# Altium schematic sheet STM32WBA52KGU6_Core.SchDoc
size 420 x 297 mm; SheetNumber: 3; SheetTotal: 3
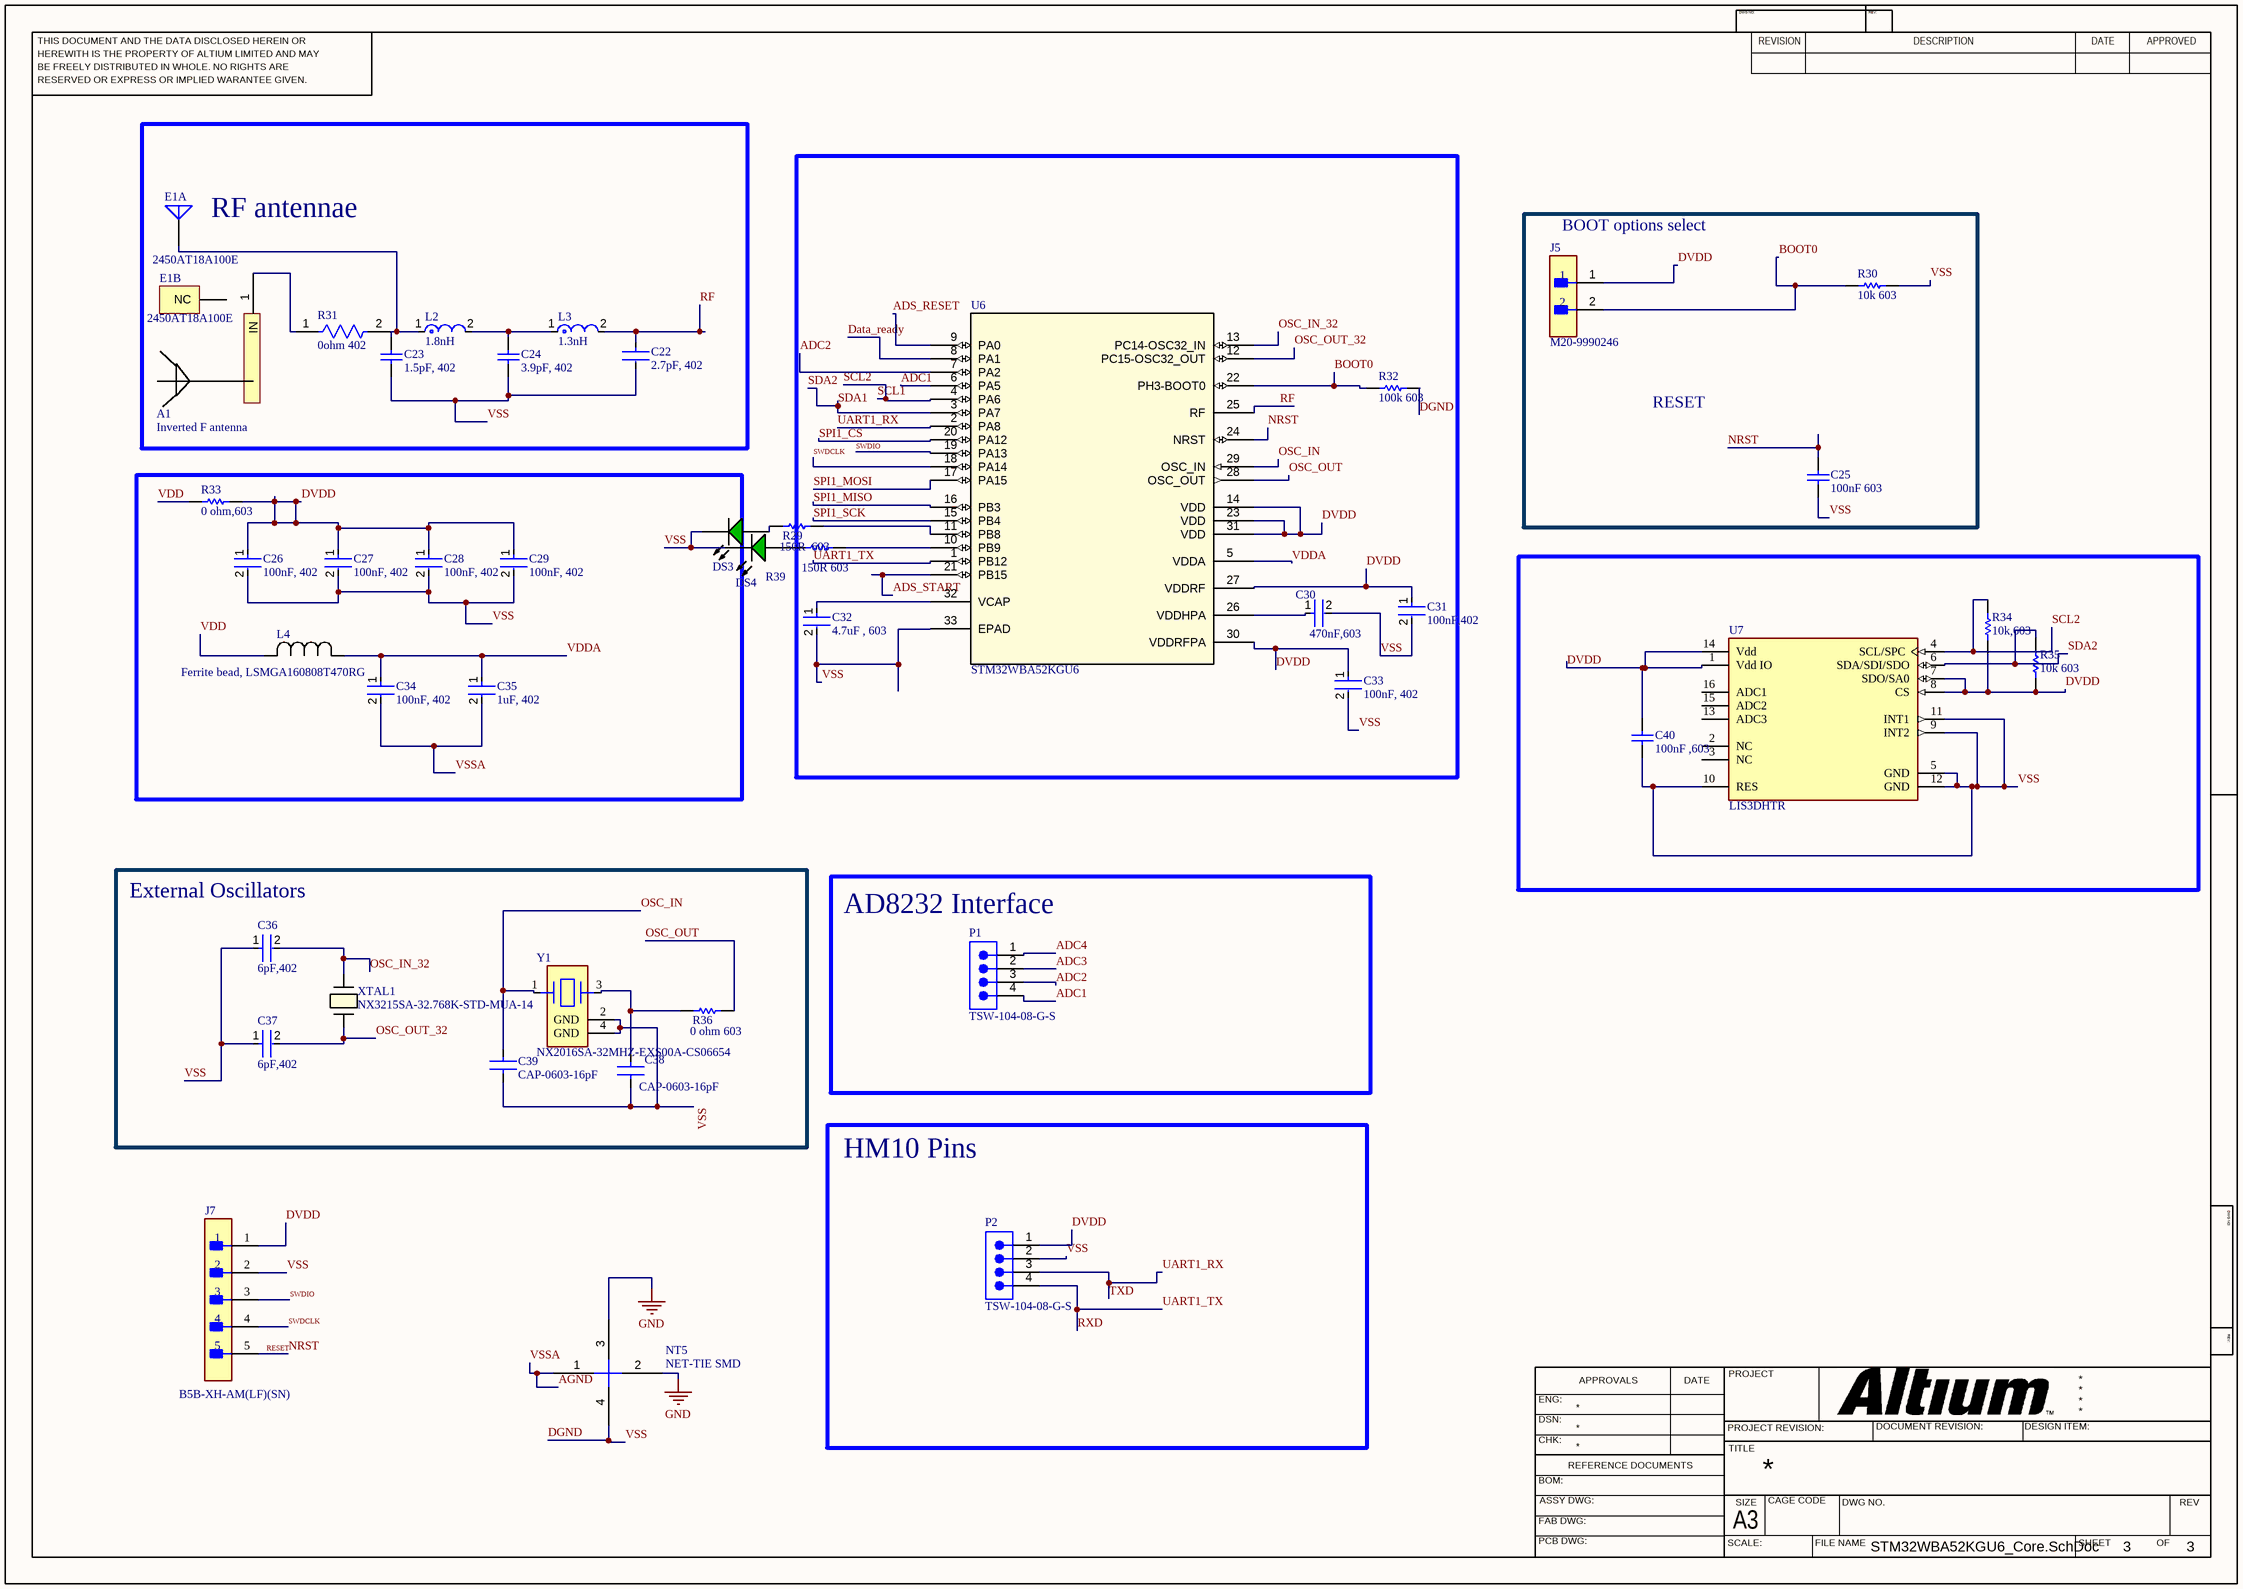
[diagram p0: STM32WBA52KGU6_Core.SchDoc]

## Parts
A1  Inverted F antenna  [Antenna]  (net tie, no BOM)
C22  2.7pF, 402  [FP-GJM155-0_05-IPC_A]
C23  1.5pF, 402  [CAPC1005X55X25ML05T10]
C24  3.9pF, 402  [CAPC1005X55X25NL05T10]
C25  100nF 603  [CAP-0603-IPC_B]
C26  100nF, 402  [FP-CC0402-MFG]
C27  100nF, 402  [FP-CC0402-MFG]
C28  100nF, 402  [FP-CC0402-MFG]
C29  100nF, 402  [FP-CC0402-MFG]
C30  470nF,603  [FP-CC0603-DA-MFG]
C31  100nF,402  [FP-CC0402-MFG]
C32  4.7uF , 603  [FP-CC0603-DA-MFG]
C33  100nF, 402  [FP-CC0402-MFG]
C34  100nF, 402  [FP-CC0402-MFG]
C35  1uF, 402  [FP-CC0402-MFG]
C36  6pF,402  [FP-GJM155-0_05-MFG]
C37  6pF,402  [FP-GJM155-0_05-MFG]
C38  CAP-0603-16pF  [FP-GCM188-0_1-IPC_A_murata]
C39  CAP-0603-16pF  [FP-GCM188-0_1-IPC_A_murata]
C40  100nF ,603  [CAP-0603-IPC_B]
DS3  LTL-1CHG  [LTST-LTL-1CHG-2]  (value not drawn)
DS4  LTL-1CHG  [LTST-LTL-1CHG-2]  (value not drawn)
E1  2450AT18A100E  [JT-2450AT18A100-2_V]  (parts A,B of 2)
J5  M20-9990246  [FP-M20-9990246-MFG]
J7  B5B-XH-AM(LF)(SN)  [FP-B5B-XH-AM_LF_SN-MFG]
L2  1.8nH  [FP-LQG15HH_02-IPC_A]
L3  1.3nH  [FP-LQG15HH_02-IPC_A]
L4  Ferrite bead, LSMGA160808T470RG  [IND_LSMG_160808_TAY]
NT5  NET-TIE SMD  [NET TIE SMD]
P1  TSW-104-08-G-S  [SMTC-TSW-104-08-X-S]
P2  TSW-104-08-G-S  [SMTC-TSW-104-08-X-S]
R29  150R  603  [RES-0603-IPC_B]
R30  10k 603  [RES-0603-IPC_B]
R31  0ohm 402  [FP-RC0402-0_4-IPC_A]
R32  100k 603  [RES-0603-IPC_B]
R33  0 ohm,603  [RES-0603-IPC_B]
R34  10k,603  [RES-0603-IPC_B]
R35  10k 603  [RES-0603-IPC_B]
R36  0 ohm 603  [RES-0603-IPC_B]
R39  150R 603  [RES-0603-IPC_B]
U6  STM32WBA52KGU6  [UFQFPN-32_STM]
U7  LIS3DHTR  [FP-LGA-16-7983231-MFG]
XTAL1  NX3215SA-32.768K-STD-MUA-14  [XTAL_NX3215SA_NDK-M]
Y1  NX2016SA-32MHZ-EXS00A-CS06654  [FP-NX2016SA-MFG]

## Blocks framed on the sheet
RF antennae: A1 C22-C24 E1 L2 L3 R31
External Oscillators: C36-C39 R36 XTAL1 Y1
AD8232 Interface: P1
HM10 Pins: P2

## Nets
GND: NT5.2 NT5.3
ADC1: P1.4 U6.6(PA5)
ADC2: P1.3 U6.7(PA2)
ADC3: P1.2
ADC4: P1.1
ADS_RESET: U6.9(PA0)
ADS_START: U6.21(PB15)
AGND: C34.2 C35.2 NT5.1  [also labelled VSSA]
BOOT0: J5.2 R30.1 R32.2 U6.22(PH3-BOOT0)
Data_ready: U6.8(PA1)
DGND: C22.2 C23.1 C24.2 C25.1 C26.2 C27.2 C28.2 C29.2 C30.2 C31.2 C32.2 C33.2 C36.1 C37.1 C38.1 C39.1 C40.1 DS3.2(K) DS4.2(K) J7.2 NT5.4 P2.2 R30.2 R32.1 U6.33(EPAD) U7.5(GND) U7.9(INT2) U7.10(RES) U7.11(INT1) U7.12(GND) Y1.2(GND) Y1.4(GND)  [also labelled VSS]
DVDD: C26.1 C27.1 C28.1 C29.1 C31.1 C33.1 C40.2 J5.1 J7.1 P2.1 R33.1 R34.1 R35.1 U6.14(VDD) U6.23(VDD) U6.27(VDDRF) U6.30(VDDRFPA) U6.31(VDD) U7.1(Vdd_IO) U7.7(SDO/SA0) U7.8(CS) U7.14(Vdd)
NRST: C25.2 J7.5 U6.24(NRST)  [also labelled RESET]
OSC_IN: C39.2 U6.29(OSC_IN) Y1.1
OSC_IN_32: C36.2 U6.13(PC14-OSC32_IN) XTAL1.1
OSC_OUT: R36.2 U6.28(OSC_OUT)
OSC_OUT_32: C37.2 U6.12(PC15-OSC32_OUT) XTAL1.2
RF: C22.1 L3.2 U6.25(RF)
RXD: P2.4 U6.1(PB12)  [also labelled UART1_TX]
SCL1: R34.2 U6.4(PA6) U7.4(SCL/SPC)  [also labelled SCL2]
SDA1: R35.2 U6.3(PA7) U7.6(SDA/SDI/SDO)  [also labelled SDA2]
SPI1_CS: U6.20(PA12)
SPI1_MISO: U6.16(PB3)
SPI1_MOSI: U6.17(PA15)
SPI1_SCK: U6.15(PB4)
SWDCLK: J7.4 U6.18(PA14)
SWDIO: J7.3 U6.19(PA13)
TXD: P2.3 U6.2(PA8)  [also labelled UART1_RX]
VDD: L4.2 R33.2
VDDA: C34.1 C35.1 L4.1 U6.5(VDDA)
NetA1_1: A1.1(IN) R31.1
NetC23_2: C23.2 E1.1(FP) L2.1
NetC24_1: C24.1 L2.2 L3.1
NetC30_1: C30.1 U6.26(VDDHPA)
NetC32_1: C32.1 U6.32(VCAP)
NetC38_2: C38.2 R36.1 Y1.3
NetDS3_1: DS3.1(A) R29.1
NetDS4_1: DS4.1(A) R39.1
NetR29_2: R29.2 U6.11(PB8)
NetR39_2: R39.2 U6.10(PB9)

Not connected (* = marked no-connect by the designer): E1 2(NC); R31 2; U7 2(NC) 3(NC) 13(ADC3) 15(ADC2) 16(ADC1)

## Notes on the sheet
- (near J5) BOOT options select
- RESET
- THIS DOCUMENT AND THE DATA DISCLOSED HEREIN OR
- HEREWITH IS THE PROPERTY OF ALTIUM LIMITED AND MAY
- DWG NO:
- REVISION
- REV:
- DESCRIPTION
- DATE
- APPROVED
- BE FREELY DISTRIBUTED IN WHOLE. NO RIGHTS ARE
- RESERVED OR EXPRESS OR IMPLIED WARANTEE GIVEN.
- ENG:
- APPROVALS
- PROJECT
- DSN:
- CHK:
- REFERENCE DOCUMENTS
- PROJECT REVISION:
- TITLE
- DOCUMENT REVISION:
- DESIGN ITEM:
- BOM:
- FAB DWG:
- PCB DWG:
- ASSY DWG:
- SCALE:
- A3
- SIZE
- CAGE CODE
- FILE NAME
- DWG NO.
- SHEET
- OF
- REV

## Library data of the parts
A1 = PCB antenna
C22 = CMP-06035-021399-1: Multi-Layer Ceramic Capacitor 2.7pF C0G  ±0.1pF 0402 Paper T/R
C23 = CMP-2008-04287-1: Part Number: GRM1555C1H1R5CA01D; Manufacturer: Murata
C24 = CMP-2008-04360-1: Part Number: GRM1555C1H3R9CA01D; Manufacturer: Murata
C25 = 1nF CAP-0603-IPC-B_1: Manufacturer: AVX Interconnect / Elco; Part Number: 0603ZC103MAT2A
C26-C29 C31 C33 C34 = CMP-03422-000048-1: CAP CER 0.1UF 16V X7R 0402; Manufacturer: YAGEO; Manufacturer Part Number: CC0402KRX7R7BB104; Material: Ceramic; Automotive Grade: NA; Temperature Coefficient: 30ppm/°C; Tolerance: 0.1; Device Class L1: Passive Components; Temperature Range Low: -55°C; Device Class L3: Ceramic Capacitors; Temperature Characteristic: X7R; Ipc Land Pattern Name: CAPC10050X50; Capacitance: 100 nF; Temperature Range High: +125°C; Voltage Rating: 16 V; Temperature: -55°C to +125°C; RoHS: TRUE; Automotive: No; Height: 0.55mm; Device Class L2: Capacitors; Digikey Description: CAP CER 0.1UF 16V X7R 0402; Package: CC0402; Footprint Url: http://www.yageo.com/exep/pages/download/literatures/UPY-C_GEN_24.pdf; ComponentLink2Description: Datasheet; Category: Cap; Lead Free: Yes; Value: 100 nF; Octopart: https://octopart.com/cc0402krx7r7bb104-yageo-42244624; ComponentLink2URL: http://www.yageo.com/documents/recent/UPY-GP_NP0_16V-to-50V_16.pdf; Mouser Description: 0402 0.1 uF 16 V ±10 % Tolerance X7R SMT Multilayer Ceramic Capacitor
C30 = CMP-03422-000540-1: CAP CER 0.47UF 16V X7R 0603; Manufacturer Part Number: CC0603KRX7R7BB474; Manufacturer: YAGEO; Temperature Coefficient: 15%; Tolerance: 0.1; Material: Ceramic; Device Class L1: Passive Components; Height: 0.9mm; Device Class L3: Ceramic Capacitors; Footprint Url: http://www.yageo.com/exep/pages/download/literatures/UPY-C_GEN_24.pdf; Automotive: No; Temperature Range High: +125°C; ComponentLink2Description: Datasheet; Temperature: -55°C to +125°C; Value: 470 nF; Digikey Description: CAP CER 0.47UF 16V X7R 0603; Capacitance: 470 nF; Mouser Description: Multilayer Ceramic Capacitors MLCC - SMD/SMT 470nF 16V X7R 10%; Temperature Range Low: -55°C; RoHS: TRUE; Voltage: 16 V; Category: Cap; Lead Free: Yes; Device Class L2: Capacitors; Octopart: https://octopart.com/cc0603krx7r7bb474-yageo-8376533; Package: CC0603-DA; Voltage Rating: 16 V; Temperature Characteristic: X7R; ComponentLink2URL: http://www.yageo.com/documents/recent/UPY-GPHC_X7R_6.3V-to-50V_18.pdf
C32 = CMP-2000-06074-2: CAP CER 4.7UF 10V X5R 0603; Manufacturer Part Number: CC0603KRX5R6BB475; Manufacturer: YAGEO; Temperature Coefficient: 15%; Tolerance: 0.1; Material: Ceramic; Voltage Rating: 10 V; ComponentLink2URL: http://www.yageo.com/documents/recent/UPY-GPHC_X7R_6.3V-to-50V_18.pdf; Package: CC0603-DA; Temperature Range High: +125°C; Category: Cap; ComponentLink2Description: Datasheet; Lead Free: Yes; Mouser Description: 4.7µF Surface Mount, MLCC 0603 (1608 Metric) Package Ceramic Capacitors; Device Class L2: Capacitors; Temperature Characteristic: X5R; Voltage: 10 V; RoHS: TRUE; Octopart: https://octopart.com/cc0603krx5r6bb475-yageo-9292507; Automotive: No; Height: 0.9mm; Temperature: -55°C to +125°C; Temperature Range Low: -55°C; Value: 4.7 uF; Digikey Description: CAP CER 4.7UF 10V X5R 0603; Device Class L1: Passive Components; Capacitance: 4.7 uF; Footprint Url: http://www.yageo.com/exep/pages/download/literatures/UPY-C_GEN_24.pdf; Device Class L3: Ceramic Capacitors
C35 = CMP-03422-000489-1: CAP CER 1UF 10V X5R 0402; Manufacturer Part Number: CC0402KRX5R6BB105; Manufacturer: YAGEO; Temperature Coefficient: 30ppm/°C; Tolerance: 0.1; Automotive Grade: NA; Material: Ceramic; Device Class L1: Passive Components; Ipc Land Pattern Name: CAPC10050X50; Height: 0.55mm; Voltage Rating: 10 V; Digikey Description: CAP CER 1UF 10V X5R 0402; RoHS: TRUE; Temperature: -55°C to +125°C; Octopart: https://octopart.com/cc0402krx5r6bb105-yageo-42244620; Mouser Description: Multilayer Ceramic Capacitors MLCC - SMD/SMT 1uF 10V X5R 10%; Temperature Characteristic: X5R; Category: Cap; Automotive: No; Temperature Range Low: -55°C; Value: 1 uF; ComponentLink2Description: Datasheet; Temperature Range High: +125°C; Package: CC0402; Capacitance: 1 uF; Footprint Url: http://www.yageo.com/exep/pages/download/literatures/UPY-C_GEN_24.pdf; ComponentLink2URL: http://www.yageo.com/documents/recent/UPY-GP_NP0_16V-to-50V_16.pdf; Lead Free: Yes; Device Class L3: Ceramic Capacitors; Device Class L2: Capacitors
C36 C37 = CMP-2008-03869-2: Multi-Layer Ceramic Capacitor 6pF C0G  ±0.25pF 0402 Paper T/R; Voltage Rating: 50V; Mount: Surface Mount; Case Code (Metric): 1005; Thickness: 0.022inch; Length: 1mm; Max Operating Temperature: 125°C; Capacitance: 6pF; Depth: 0.5mm; Width: 0.02inch; Dielectric: C0G; Voltage: 50V; Radiation Hardening: No; Min Operating Temperature: -55°C; Case/Package: 0402; Height: 0.5mm; Termination: SMD/SMT; Packaging: Tape and Reel; Voltage Rating (DC): 50V; Package Quantity: 10000; Lead Free: Lead Free; Case Code (Imperial): 0402
C38 C39 = CAP-0603_16V- 16pf_murata: Ceramic Capacitor for Automotive 16pF  ±5% 100VDC C0G 0603 Paper T/R; Voltage Rating: 100V; Min Operating Temperature: -55°C; Package Quantity: 4000; Case/Package: 0603; Height: 0.8mm; Tolerance: 5%; Depth: 0.8mm; Thickness: 0.035inch; Max Operating Temperature: 125°C; Ratings: AEC-Q200; Packaging: Tape and Reel; Termination: SMD/SMT; Mount: Surface Mount; Voltage Rating (DC): 100V; Case Code (Imperial): 0603; Length: 1.6mm; Capacitance: 16pF; Case Code (Metric): 1608; Dielectric: C0G; Radiation Hardening: No; Width: 0.031inch
C40 = CAP-0603-IPC-B: Manufacturer: AVX Interconnect / Elco; Part Number: 0603ZC103MAT2A
DS3 DS4 = CMP-007-00019-2: LED Uni-Color Green, 100 mW, 30 mA, -55 to 100 degC, 2-Pin THD, RoHS, Bulk; Manufacturer: Lite-On; Power: 100mW; Forward Voltage: 2.6V; Forward Current: 30mA; Nominal Vf: 2.1V; Lens Style: Dome; Viewing Angle: 60degrees; Luminous Intensity: 12.6mcd; Max Operating Temperature: 100°C; Case/Package: Radial; Package Reference: LTL-1CHG; Manufacturer URL: http://www.us.liteon.com/; Package Quantity: 1000; Colour: Green; Packaging: Bulk; RoHS Compliant: True; Datasheet URL: http://datasheet.octopart.com/LTL-1CHG-Lite-On-datasheet-143841.pdf; Package Description: 2-Pin Through Hole Device, Dia 3.8 mm; Min Operating Temperature: -55°C; Mounting Technology: TH; Pins: 2; Illumination Colour: Green; Datasheet Version: Mar-00
E1 = CMP-2000-05167-1: Ceramic Antenna, 2.45 GHZ, 2 W, -40 to 125 degC, 2-Pin SMD, RoHS, Tape and Reel; Manufacturer: Johanson Technology; Maximum Frequency: 2500MHz; Typical Antenna Gain: 0.5dB; Minimum Frequency: 2400MHz; Manufacturer URL: https://www.johansontechnology.com/; Type: Ceramic; Datasheet Version: Rev. 1.3, 07/2014; Category: Antenna; Package: 2Case18-4; Datasheet URL: http://www.johansontechnology.com/datasheets/antennas/2450AT18A100.pdf
J5 = CMP-15831-000009-1: CONN HEADER VERT 2POS 2.54MM; Manufacturer: Harwin; Conn Gender: Male; Conn Orientation: Vertical; Number Of Contacts: 2; Current Rating: 3A; ComponentLink2URL: https://cdn.harwin.com/pdfs/M20-999.pdf; ComponentLink2Description: Datasheet; Package: M20-9990246; Temperature: -40°C to +105°C; Octopart: https://octopart.com/m20-9990246-harwin-2590635; Mouser Description: 2.54mm (0.1") Pitch SIL Vertical PC Tail Pin Header, 6.1mm mating pin height, tin, 2 contacts; Temperature Range High: +105°C; Device Class L1: Connectors; RoHS: TRUE; Automotive: No; Height: 8.99mm; Number Of Rows: 1; Contact Material: Tin,Nickel; Category: Conn; Pitch: 2.54mm; Lead Free: Yes; Digikey Description: CONN HEADER VERT 2POS 2.54MM; Manufacturer Part Number: M20-9990246; Temperature Range Low: -40°C; Device Class L3: unset; Device Class L2: Headers and Wire Housings
J7 = CMP-17439-000304-1: CONN HEADER VERT 5POS 2.5MM; Mated Stacking Heights: 9.8mm; Voltage Rating: 250V; Max Current Rating: 3A; Number of Positions: 5; Contact Resistance: 20mR; Depth: 5.75mm; Connector Type: Header; Color: Green; Insulation Material: Nylon; Contact Plating: Copper; Length: 14.9mm; Fastening Type: Detent; Contact Material: Brass; Number of Rows: 1; Contact Type: Male Pin; Housing Material: Polyamide; Housing Color: White; Lead Free: Lead Free; Max Voltage Rating (AC): 250V; Mount: Through Hole; Contact Shape: Square; Min Operating Temperature: -25°C; Packaging: Bulk; Orientation: Straight; Insulation Color: Natural; Series: XH; Flammability Rating: UL94 V-0; Contact Finish - Mating: TIN; Max Operating Temperature: 85°C; Termination: Solder; Pitch: 2.5mm
L2 = CMP-06042-005877-1: Multilayer type RF Inductor 1.8nH ±0.3nH 0.08Ω 950mA 0402; Self Resonant Frequency: 6GHz; Core Material: Air; DC Current: 300mA; Q Factor: 8; Test Frequency: 100MHz; Shielding: Unshielded; DC Resistance (DCR): 100mR; Inductance: 1.8nH; Packaging: Tape and Reel; Lead Free: Lead Free; Min Operating Temperature: -55°C; Height - Seated (Max): 0.022inch; Case/Package: 0402; Mount: Surface Mount; Package Quantity: 1; Width: 0.02inch; Length: 0.039inch; Max Operating Temperature: 125°C; Depth: 0.55mm; Height: 0.5mm; Radiation Hardening: No; Max DC Current: 300mA; Case Code (Metric): 1005; Termination: SMD/SMT; Military Standard: Not; Current Rating: 300mA; Case Code (Imperial): 0402
L3 = CMP-06042-003622-1: Multilayer type RF Inductor 1.3nH ±0.3nH 0.07Ω 1000mA 0402; Self Resonant Frequency: 6GHz; Shielding: Unshielded; Test Frequency: 100MHz; Current Rating: 300mA; Q Factor: 8; Tolerance: 5%; DC Resistance (DCR): 90mR; Core Material: Air; Depth: 0.55mm; Mount: Surface Mount; Max Operating Temperature: 125°C; Height - Seated (Max): 0.022inch; Min Operating Temperature: -55°C; Packaging: Tape and Reel; Inductance: 1.3nH; Max DC Current: 300mA; DC Current: 300mA; Width: 0.5mm; Termination: SMD/SMT; Military Standard: Not; Case Code (Metric): 1005; Radiation Hardening: No; Length: 1mm; Height: 0.5mm; Case/Package: 0402; Current: 300mA; Case Code (Imperial): 0402; Package Quantity: 10000
L4 = LSMGA160808T470RG Feerite bead: Description; Manufacturer_Name: Taiyo Yuden; Type: Ferrite Beads and Chips; Copyright: Copyright (C) 2025 Ultra Librarian. All rights reserved.; Manufacturer_Part_Number: LSMGA160808T470RG
P1 P2 = CMP-1024-00357-1: 0.025" SQ Post Header, Through-hole, Vertical, -55 to 125 degC, 2.54 mm Pitch, 4-Pin, Male, RoHS; Manufacturer: Samtec; Pitch: 2.54 mm; RoHS: True; ComponentLink3URL: http://www.samtec.com/documents/webfiles/cpdf/TSW-XXX-XX-XXX-X-XX-XXX-MKT.pdf; Mounting Technology: Through-hole; ComponentLink2URL: http://www.samtec.com/documents/webfiles/pdf/TSW_TH.PDF; ComponentLink1URL: http://www.samtec.com; ComponentLink3Description: Package Specification; PackageVersion: DM, 8/1988; ComponentLink2Description: Datasheet; PackageReference: TSW-104-08-X-S; PackageDescription: .025[0.64] SQ. Post Terminal Strip Assembly; PartNumber: TSW-104-08-G-S; ComponentLink1Description: Manufacturer URL; Temperature Range: -55 to 125 degC; DatasheetVersion: F-214; Orientation: Vertical
R29 R33 R36 R39 = RES-0603-IPC-B: Max Power Dissipation: 100mW; Temperature Coefficient: 50ppm/°C; Tolerance: 0.5%; Resistance: 4.7kR; Height: 0.022inch; Width: 0.032inch; RoHS Compliant: Yes; Features: Moisture Resistant; Packaging: Tape and Reel; Number of Terminations: 2; Max Operating Temperature: 155°C; Series: AT; Min Operating Temperature: -55°C; Resistor Type: Thin Film; Length: 0.063inch; Case/Package: 0603
R30 R34 R35 = 10k RES-0603-IPC-B_1_1: Max Power Dissipation: 100mW; Temperature Coefficient: 50ppm/°C; Tolerance: 0.5%; Resistance: 4.7kR; Height: 0.022inch; Width: 0.032inch; RoHS Compliant: Yes; Features: Moisture Resistant; Packaging: Tape and Reel; Number of Terminations: 2; Max Operating Temperature: 155°C; Series: AT; Min Operating Temperature: -55°C; Resistor Type: Thin Film; Length: 0.063inch; Case/Package: 0603
R31 = CMP-2002-07342-2: RES SMD 0 OHM JUMPER 1/16W 0402; Resistance: 0R; Temperature Coefficient: 200ppm/°C; Tolerance: 1%; Power Rating: 62.5mW; Voltage Rating: 50V; Max Power Dissipation: 63mW; Features: Moisture Resistant; Length: 1mm; Case Code (Metric): 1005; Series: RC; RoHS Compliant: Yes; Resistor Type: Thick Film; Height: 0.35mm; Min Operating Temperature: -55°C; Case Code (Imperial): 0402; Number of Terminations: 2; Contact Plating: Tin; Case/Package: 0402; Size Code: 0402; Termination: SMD/SMT; Max Operating Temperature: 155°C; Width: 0.5mm; Mount: Surface Mount; Lead Free: Lead Free; Packaging: Tape and Reel; Radiation Hardening: No
R32 = 100k RES-0603-IPC-B_1: Max Power Dissipation: 100mW; Temperature Coefficient: 50ppm/°C; Tolerance: 0.5%; Resistance: 4.7kR; Height: 0.022inch; Width: 0.032inch; RoHS Compliant: Yes; Features: Moisture Resistant; Packaging: Tape and Reel; Number of Terminations: 2; Max Operating Temperature: 155°C; Series: AT; Min Operating Temperature: -55°C; Resistor Type: Thin Film; Length: 0.063inch; Case/Package: 0603
U6 = STM32WBA52KGU6: Ultra-low-power, Arm Cortex-M33 Trust Zone MCU 100 MHz with 1 Mbyte of Flash memory,  Bluetooth LE 5.4; Manufacturer_Name: STMicroelectronics; Copyright: Copyright (C) 2025 Ultra Librarian. All rights reserved.; Manufacturer_Part_Number: STM32WBA52KGU6; RefDes: RefDes; Type: Type
U7 = CMP-0234-00055-6: ACCEL 2-16G I2C/SPI 16LGA; Max Supply Voltage: 3.6V; Bandwidth: 5kHz; Min Supply Voltage (DC): 1.71V; Interface: I2C; Axis: X, Y, Z; Operating Supply Voltage: 2.5V; Operating Supply Current: 11uA; Output Type: Digital; Resolution: 16b; Sensor Type: 3 Axis; Series: -; Package Quantity: 1; Case/Package: LGA; Radiation Hardening: No; Min Operating Temperature: -40°C; Length: 3mm; Max Supply Voltage (DC): 3.6V; Lead Free: Lead Free; Height: 1mm; Number of Pins: 16; RoHS Compliant: Yes; Packaging: Tape and Reel; Width: 3mm; Contact Plating: Gold; Max Operating Temperature: 85°C; Min Supply Voltage: 1.71V; REACH SVHC: No SVHC; Depth: 3mm
XTAL1 = NX3215SA-32.768K-STD-MUA-14: Description; Manufacturer_Name: NDK; Type: Crystals; Copyright: Copyright (C) 2025 Ultra Librarian. All rights reserved.; Manufacturer_Part_Number: NX3215SA-32.768K-STD-MUA-14
Y1 = CMP-200220-000017-1: CRYSTAL 32.0000MHZ 8PF SMD; Frequency: 32MHz; ESR (Equivalent Series Resistance): 60R; Ratings: AEC-Q200; Mount: Surface Mount; Case/Package: SMD/SMT; Packaging: Tape and Reel; Load Capacitance: 8pF; Min Operating Temperature: -40°C; Max Operating Temperature: 125°C